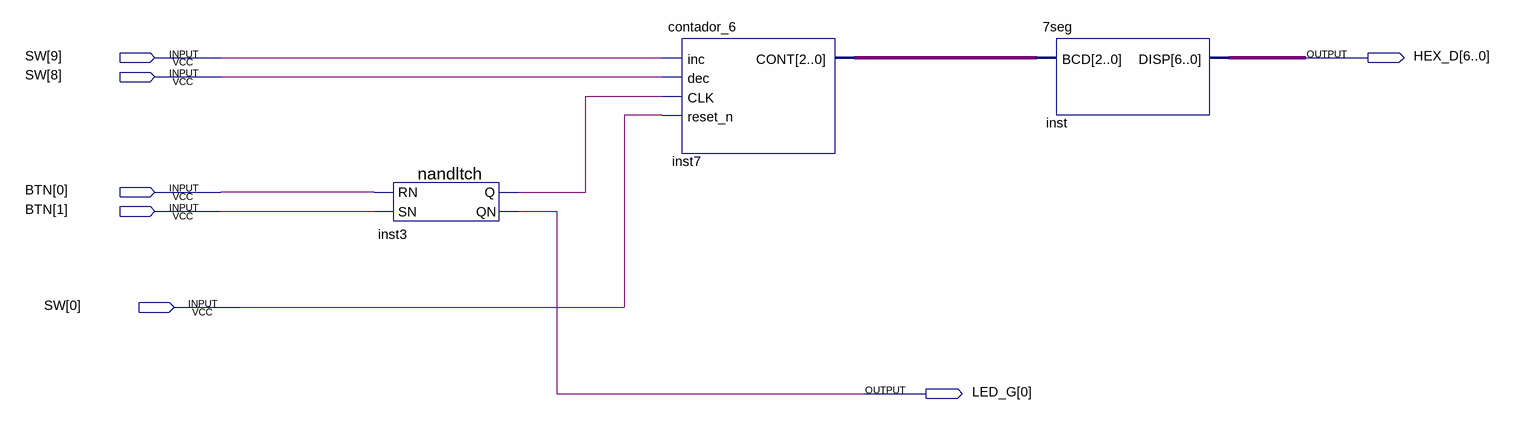
[diagram p0: schematic sheet]
// Quartus schematic circuito_prueba.bdf as structural Verilog: 3 symbols, 7 pins
module circuito_prueba (
  input  [9:0] SW,
  input  [1:0] BTN,
  output [6:0] HEX_D,
  output [0:0] LED_G
);

  wire inst3_q;
  wire [2:0] inst7_cont;

  nandltch inst3 (.RN(BTN[0]), .SN(BTN[1]), .QN(LED_G[0]), .Q(inst3_q));
  contador_6 inst7 (.inc(SW[9]), .dec(SW[8]), .CLK(inst3_q), .reset_n(SW[0]), .CONT(inst7_cont));
  \7seg  inst (.BCD(inst7_cont), .DISP(HEX_D));
endmodule
